# Altium schematic sheet RF.SchDoc
size A; SheetNumber: 5; SheetTotal: 6
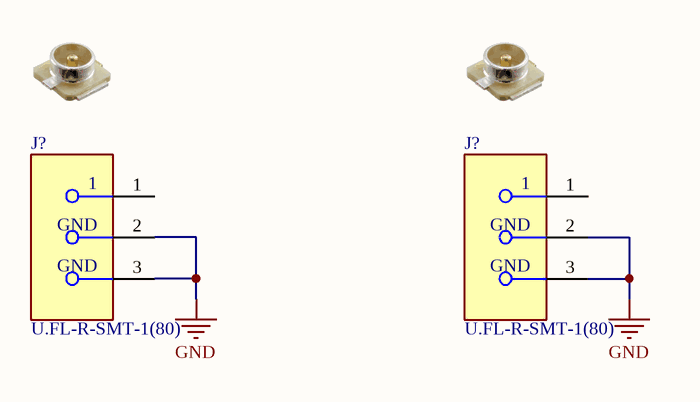
[diagram p0: RF.SchDoc]

## Parts
(Parts that share a designator on the sheet are numbered #1, #2 ... from top to bottom, then left to right.)
J?#1  U.FL-R-SMT-1(80)  [FP-U_FL-R-SMT-1_80-MFG]
J?#2  U.FL-R-SMT-1(80)  [FP-U_FL-R-SMT-1_80-MFG]

## Nets
GND: J?#1.2(GND) J?#1.3(GND) J?#2.2(GND) J?#2.3(GND)

Not connected (* = marked no-connect by the designer): J?#1 1; J?#2 1

## Library data of the parts
J?#1 J?#2 = CMP-11598-000004-1: CONN U.FL RCPT STR 50 OHM SMD; Mating Cycles: 30; Impedance: 50R; Body Plating: Silver; Center Contact Plating: Gold; Body Material: Bronze; Dielectric Material: Polymer; Connector Type: Receptacle; Number of Ports: 1; Max Frequency: 6GHz; Mount: Surface Mount; Termination: Solder; Case/Package: SMD/SMT; Min Operating Temperature: -40°C; Series: U.FL; Max Operating Temperature: 90°C; Fastening Type: SNAP-ON; RoHS Compliant: Yes; Packaging: Tape and Reel; Package Quantity: 10000; Contact Material: Brass; Housing Color: Beige; Lead Free: Lead Free